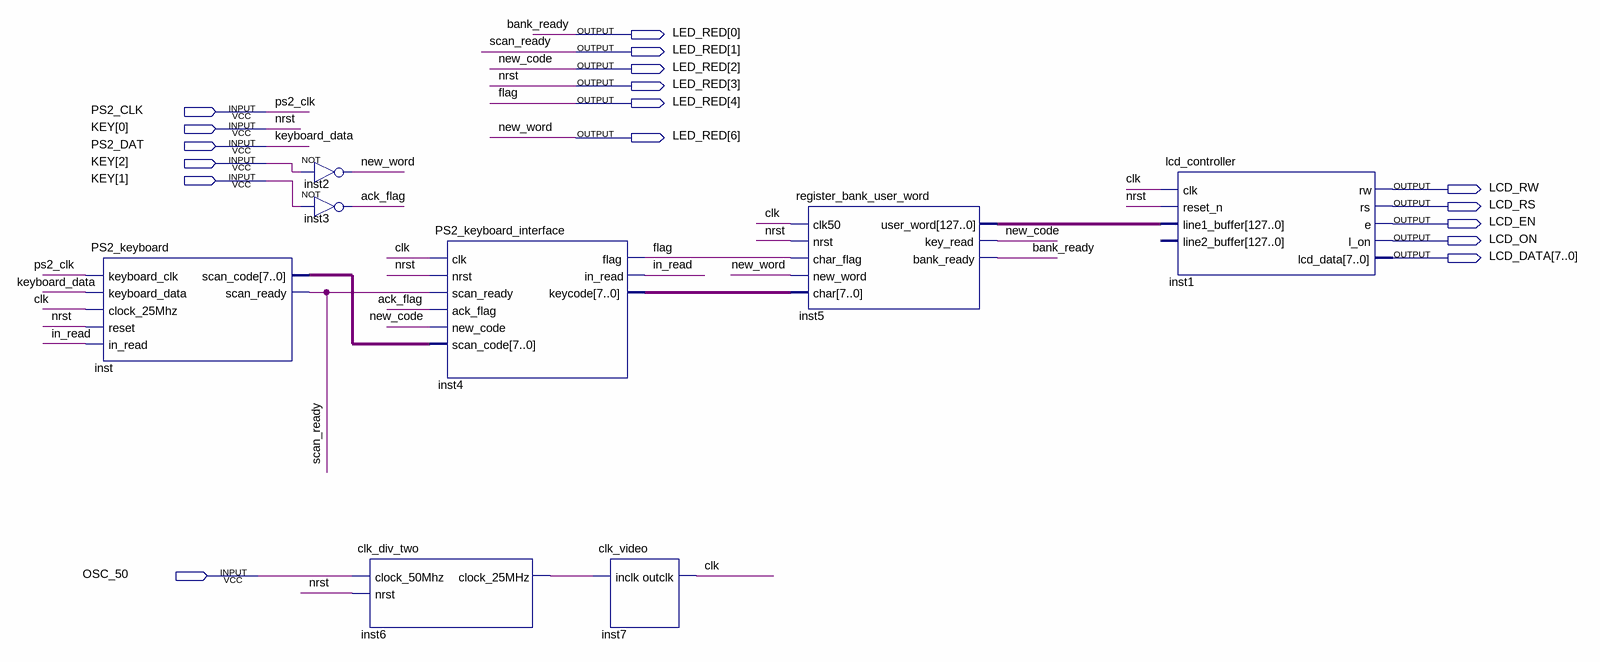
[diagram p0: schematic sheet]
// Quartus schematic keyboard_test.bdf as structural Verilog: 8 symbols, 17 pins
module keyboard_test (
  input  PS2_CLK,
  input  [2:0] KEY,
  input  PS2_DAT,
  input  OSC_50,
  output [6:0] LED_RED,
  output LCD_RW,
  output LCD_RS,
  output LCD_EN,
  output LCD_ON,
  output [7:0] LCD_DATA
);

  wire ack_flag, clk, in_read, inst6_clock_25mhz;
  wire [7:0] inst4_keycode, inst_scan_code;
  wire [127:0] inst5_user_word;

  PS2_keyboard inst (
    .keyboard_clk(PS2_CLK), .keyboard_data(PS2_DAT), .clock_25Mhz(clk), .reset(KEY[0]), .in_read(in_read),
    .scan_code(inst_scan_code), .scan_ready(LED_RED[1]));
  not inst2 (LED_RED[6], KEY[2]);
  not inst3 (ack_flag, KEY[1]);
  clk_div_two inst6 (.clock_50Mhz(OSC_50), .nrst(KEY[0]), .clock_25MHz(inst6_clock_25mhz));
  PS2_keyboard_interface inst4 (
    .clk(clk), .nrst(KEY[0]), .scan_ready(LED_RED[1]), .ack_flag(ack_flag), .new_code(LED_RED[2]),
    .scan_code(inst_scan_code), .flag(LED_RED[4]), .in_read(in_read), .keycode(inst4_keycode));
  clk_video inst7 (.inclk(inst6_clock_25mhz), .outclk(clk));
  register_bank_user_word inst5 (
    .clk50(clk), .nrst(KEY[0]), .char_flag(LED_RED[4]), .new_word(LED_RED[6]), .char(inst4_keycode),
    .user_word(inst5_user_word), .key_read(LED_RED[2]), .bank_ready(LED_RED[0]));
  lcd_controller inst1 (
    .clk(clk), .reset_n(KEY[0]), .line1_buffer(inst5_user_word), .rw(LCD_RW), .rs(LCD_RS), .e(LCD_EN),
    .l_on(LCD_ON), .lcd_data(LCD_DATA));  // open: line2_buffer

  assign LED_RED[3] = KEY[0];

  // Other names for the same wires on the sheet: bank_ready = LED_RED[0]; flag = LED_RED[4]; keyboard_data = PS2_DAT;
  //   new_code = LED_RED[2]; new_word = LED_RED[6]; nrst = KEY[0]; scan_ready = LED_RED[1]
endmodule
